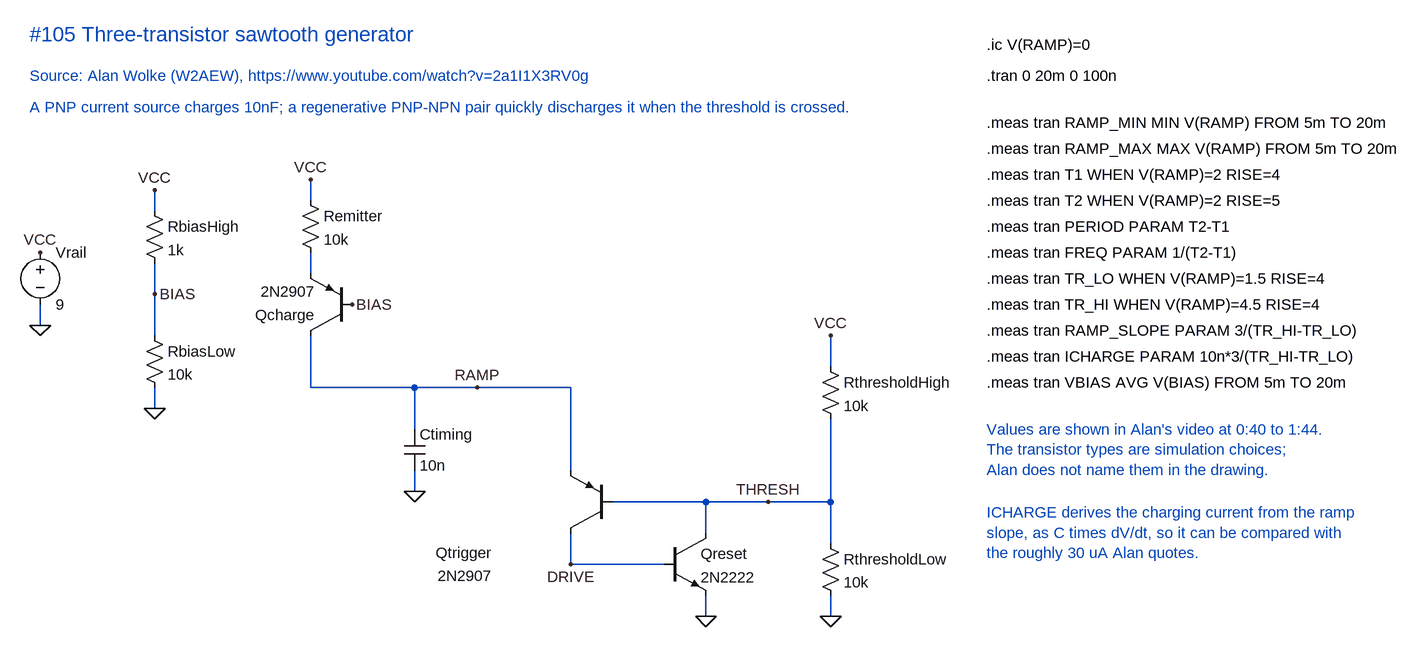
[diagram p0: schematic Three transistor sawtooth.asc]
Three transistor sawtooth.asc, the LTspice schematic file:
Version 4.1
SHEET 1 1550 1150
WIRE 64 80 64 48
WIRE 240 -128 240 -96
WIRE 240 32 240 -16
WIRE 240 96 240 32
WIRE 240 208 240 176
WIRE 480 -144 480 -112
WIRE 480 -32 480 0
WIRE 480 176 480 96
WIRE 640 176 480 176
WIRE 640 240 640 176
WIRE 640 336 640 304
WIRE 736 176 640 176
WIRE 880 176 736 176
WIRE 880 304 880 176
WIRE 880 448 880 400
WIRE 1024 448 880 448
WIRE 1088 352 1088 400
WIRE 1088 528 1088 496
WIRE 944 352 1088 352
WIRE 1280 352 1088 352
WIRE 1280 96 1280 144
WIRE 1280 352 1280 224
WIRE 1280 416 1280 352
WIRE 1280 528 1280 496
FLAG 64 -32 VCC
FLAG 64 80 0
FLAG 240 -128 VCC
FLAG 240 32 BIAS
FLAG 240 208 0
FLAG 480 -144 VCC
FLAG 544 48 BIAS
FLAG 736 176 RAMP
FLAG 640 336 0
FLAG 1184 352 THRESH
FLAG 880 448 DRIVE
FLAG 1088 528 0
FLAG 1280 96 VCC
FLAG 1280 528 0
SYMBOL voltage 64 -48 R0
SYMATTR InstName Vrail
SYMATTR Value 9
SYMBOL res 224 -112 R0
SYMATTR InstName RbiasHigh
SYMATTR Value 1k
SYMBOL res 224 80 R0
SYMATTR InstName RbiasLow
SYMATTR Value 10k
SYMBOL res 464 -128 R0
SYMATTR InstName Remitter
SYMATTR Value 10k
SYMBOL pnp 544 96 R180
SYMATTR InstName Qcharge
SYMATTR Value 2N2907
SYMBOL cap 624 240 R0
SYMATTR InstName Ctiming
SYMATTR Value 10n
SYMBOL pnp 944 400 R180
WINDOW 0 184 -30 Left 2
WINDOW 3 184 -66 Left 2
SYMATTR InstName Qtrigger
SYMATTR Value 2N2907
SYMBOL npn 1024 400 R0
SYMATTR InstName Qreset
SYMATTR Value 2N2222
SYMBOL res 1264 128 R0
SYMATTR InstName RthresholdHigh
SYMATTR Value 10k
SYMBOL res 1264 400 R0
SYMATTR InstName RthresholdLow
SYMATTR Value 10k
TEXT 48 -368 Left 3 ;#105 Three-transistor sawtooth generator
TEXT 48 -304 Left 2 ;Source: Alan Wolke (W2AEW), https://www.youtube.com/watch?v=2a1I1X3RV0g
TEXT 48 -256 Left 2 ;A PNP current source charges 10nF; a regenerative PNP-NPN pair quickly discharges it when the threshold is crossed.
TEXT 1520 -352 Left 2 !.ic V(RAMP)=0
TEXT 1520 -304 Left 2 !.tran 0 20m 0 100n
TEXT 1520 -232 Left 2 !.meas tran RAMP_MIN MIN V(RAMP) FROM 5m TO 20m
TEXT 1520 -192 Left 2 !.meas tran RAMP_MAX MAX V(RAMP) FROM 5m TO 20m
TEXT 1520 -152 Left 2 !.meas tran T1 WHEN V(RAMP)=2 RISE=4
TEXT 1520 -112 Left 2 !.meas tran T2 WHEN V(RAMP)=2 RISE=5
TEXT 1520 -72 Left 2 !.meas tran PERIOD PARAM T2-T1
TEXT 1520 -32 Left 2 !.meas tran FREQ PARAM 1/(T2-T1)
TEXT 1520 8 Left 2 !.meas tran TR_LO WHEN V(RAMP)=1.5 RISE=4
TEXT 1520 48 Left 2 !.meas tran TR_HI WHEN V(RAMP)=4.5 RISE=4
TEXT 1520 88 Left 2 !.meas tran RAMP_SLOPE PARAM 3/(TR_HI-TR_LO)
TEXT 1520 128 Left 2 !.meas tran ICHARGE PARAM 10n*3/(TR_HI-TR_LO)
TEXT 1520 168 Left 2 !.meas tran VBIAS AVG V(BIAS) FROM 5m TO 20m
TEXT 1520 240 Left 2 ;Values are shown in Alan's video at 0:40 to 1:44.\nThe transistor types are simulation choices;\nAlan does not name them in the drawing.
TEXT 1520 368 Left 2 ;ICHARGE derives the charging current from the ramp\nslope, as C times dV/dt, so it can be compared with\nthe roughly 30 uA Alan quotes.

The netlist it stands for:
* Three transistor sawtooth.asc
Vrail VCC 0 9
RbiasHigh VCC BIAS 1k
RbiasLow BIAS 0 10k
Remitter VCC N001 10k
Qcharge RAMP BIAS N001 0 2N2907
Ctiming RAMP 0 10n
Qtrigger DRIVE THRESH RAMP 0 2N2907
Qreset THRESH DRIVE 0 0 2N2222
RthresholdHigh VCC THRESH 10k
RthresholdLow THRESH 0 10k
.model NPN NPN
.model PNP PNP
.lib standard.bjt
* #105 Three-transistor sawtooth generator
* Source: Alan Wolke (W2AEW), https://www.youtube.com/watch?v=2a1I1X3RV0g
* A PNP current source charges 10nF; a regenerative PNP-NPN pair quickly discharges it when the threshold is crossed.
.ic V(RAMP)=0
.tran 0 20m 0 100n
.meas tran RAMP_MIN MIN V(RAMP) FROM 5m TO 20m
.meas tran RAMP_MAX MAX V(RAMP) FROM 5m TO 20m
.meas tran T1 WHEN V(RAMP)=2 RISE=4
.meas tran T2 WHEN V(RAMP)=2 RISE=5
.meas tran PERIOD PARAM T2-T1
.meas tran FREQ PARAM 1/(T2-T1)
.meas tran TR_LO WHEN V(RAMP)=1.5 RISE=4
.meas tran TR_HI WHEN V(RAMP)=4.5 RISE=4
.meas tran RAMP_SLOPE PARAM 3/(TR_HI-TR_LO)
.meas tran ICHARGE PARAM 10n*3/(TR_HI-TR_LO)
.meas tran VBIAS AVG V(BIAS) FROM 5m TO 20m
* Values are shown in Alan's video at 0:40 to 1:44.
* The transistor types are simulation choices;
* Alan does not name them in the drawing.
* ICHARGE derives the charging current from the ramp
* slope, as C times dV/dt, so it can be compared with
* the roughly 30 uA Alan quotes.
.backanno
.end